# Altium schematic sheet PCA9685.SchDoc
size A4; SheetNumber: 4; SheetTotal: 9
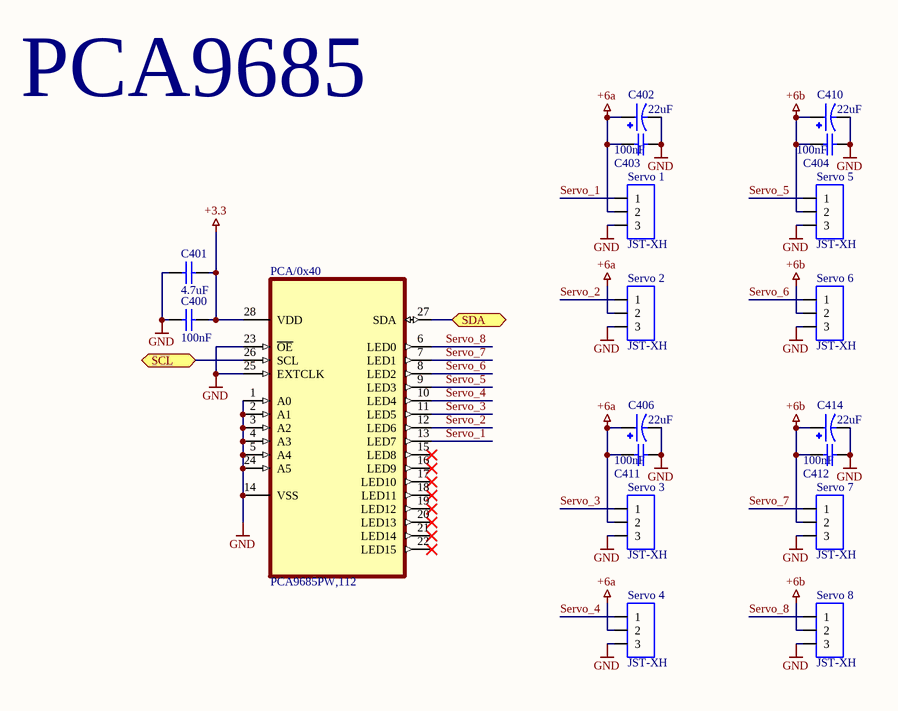
[diagram p0: PCA9685.SchDoc]

## Parts
C400  value 100nF  [0603]  (hidden comment: 0603)
C401  value 4.7uF  [0603]  (hidden comment: 0603)
C402  value 22uF  [CAP_EEEFN1A220R]  (hidden comment: ELKO)
C403  value 100nF  [0603]  (hidden comment: 0603)
C404  value 100nF  [0603]  (hidden comment: 0603)
C406  value 22uF  [CAP_EEEFN1A220R]  (hidden comment: ELKO)
C410  value 22uF  [CAP_EEEFN1A220R]  (hidden comment: ELKO)
C411  value 100nF  [0603]  (hidden comment: 0603)
C412  value 100nF  [0603]  (hidden comment: 0603)
C414  value 22uF  [CAP_EEEFN1A220R]  (hidden comment: ELKO)
PCA/0x40  PCA9685PW,112  [SOP65P640X110-28N]
Servo_1  JST-XH  [Sip-3]
Servo_2  JST-XH  [Sip-3]
Servo_3  JST-XH  [Sip-3]
Servo_4  JST-XH  [Sip-3]
Servo_5  JST-XH  [Sip-3]
Servo_6  JST-XH  [Sip-3]
Servo_7  JST-XH  [Sip-3]
Servo_8  JST-XH  [Sip-3]

## Ports
SCL (bidir, see BNO085[2C], LSM6DSO[2B], Raspberry_PI5[2B], Test_Sensor_Connectoren[1D], Test_Sensor_Connectoren[2D]), SDA (bidir, see BNO085[2C], LSM6DSO[2B], Raspberry_PI5[2B], Test_Sensor_Connectoren[1C], Test_Sensor_Connectoren[2D])

## Nets
+3.3: C400.2 C401.2 PCA/0x40.28(VDD)
+6a: C402.1 C403.2 C406.1 C411.2 Servo_1.2 Servo_2.2 Servo_3.2 Servo_4.2
+6b: C404.2 C410.1 C412.2 C414.1 Servo_5.2 Servo_6.2 Servo_7.2 Servo_8.2
GND: C400.1 C401.1 C402.2 C403.1 C404.1 C406.2 C410.2 C411.1 C412.1 C414.2 PCA/0x40.1(A0) PCA/0x40.2(A1) PCA/0x40.3(A2) PCA/0x40.4(A3) PCA/0x40.5(A4) PCA/0x40.14(VSS) PCA/0x40.23(~{OE}) PCA/0x40.24(A5) PCA/0x40.25(EXTCLK) Servo_1.3 Servo_2.3 Servo_3.3 Servo_4.3 Servo_5.3 Servo_6.3 Servo_7.3 Servo_8.3
SCL: PCA/0x40.26(SCL) ; port SCL
SDA: PCA/0x40.27(SDA) ; port SDA
Servo_1: PCA/0x40.13(LED7) Servo_1.1
Servo_2: PCA/0x40.12(LED6) Servo_2.1
Servo_3: PCA/0x40.11(LED5) Servo_3.1
Servo_4: PCA/0x40.10(LED4) Servo_4.1
Servo_5: PCA/0x40.9(LED3) Servo_5.1
Servo_6: PCA/0x40.8(LED2) Servo_6.1
Servo_7: PCA/0x40.7(LED1) Servo_7.1
Servo_8: PCA/0x40.6(LED0) Servo_8.1

Not connected (* = marked no-connect by the designer): PCA/0x40 15(LED8)* 16(LED9)* 17(LED10)* 18(LED11)* 19(LED12)* 20(LED13)* 21(LED14)* 22(LED15)*

## Notes on the sheet
- PCA9685

## Library data of the parts
C400 C401 C403 C404 C411 C412 = KO: Kondensator
C402 C406 C410 C414 = EEEFN1A220R: CAP ALUM 22UF 20% 10V SMD; MF: Panasonic; SnapEDA_Link: https://www.snapeda.com/parts/EEEFN1A220R/Panasonic/view-part/?ref=snap; Availability: In Stock; Purchase-URL: https://pricing.snapeda.com/search/part/EEEFN1A220R/?ref=eda; MP: EEEFN1A220R; Price: None; Package: RADIAL-2 Panasonic; Check_prices: https://www.snapeda.com/parts/EEEFN1A220R/Panasonic/view-part/?ref=eda
PCA/0x40 = PCA9685PW,112: LED Driver IC 16 Output Linear - PWM Dimming 25mA 28-TSSOP; MF: NXP USA; SnapEDA_Link: https://www.snapeda.com/parts/PCA9685PW,112/NXP+Semiconductors/view-part/?ref=snap; Package: TSSOP-28 NXP Semiconductors; Value: *; MP: PCA9685PW,112; Check_prices: https://www.snapeda.com/parts/PCA9685PW,112/NXP+Semiconductors/view-part/?ref=eda
Servo_1-Servo_8 = CON3